# Altium schematic sheet Power Distribution.SchDoc
size B; SheetNumber: 3; SheetTotal: 6
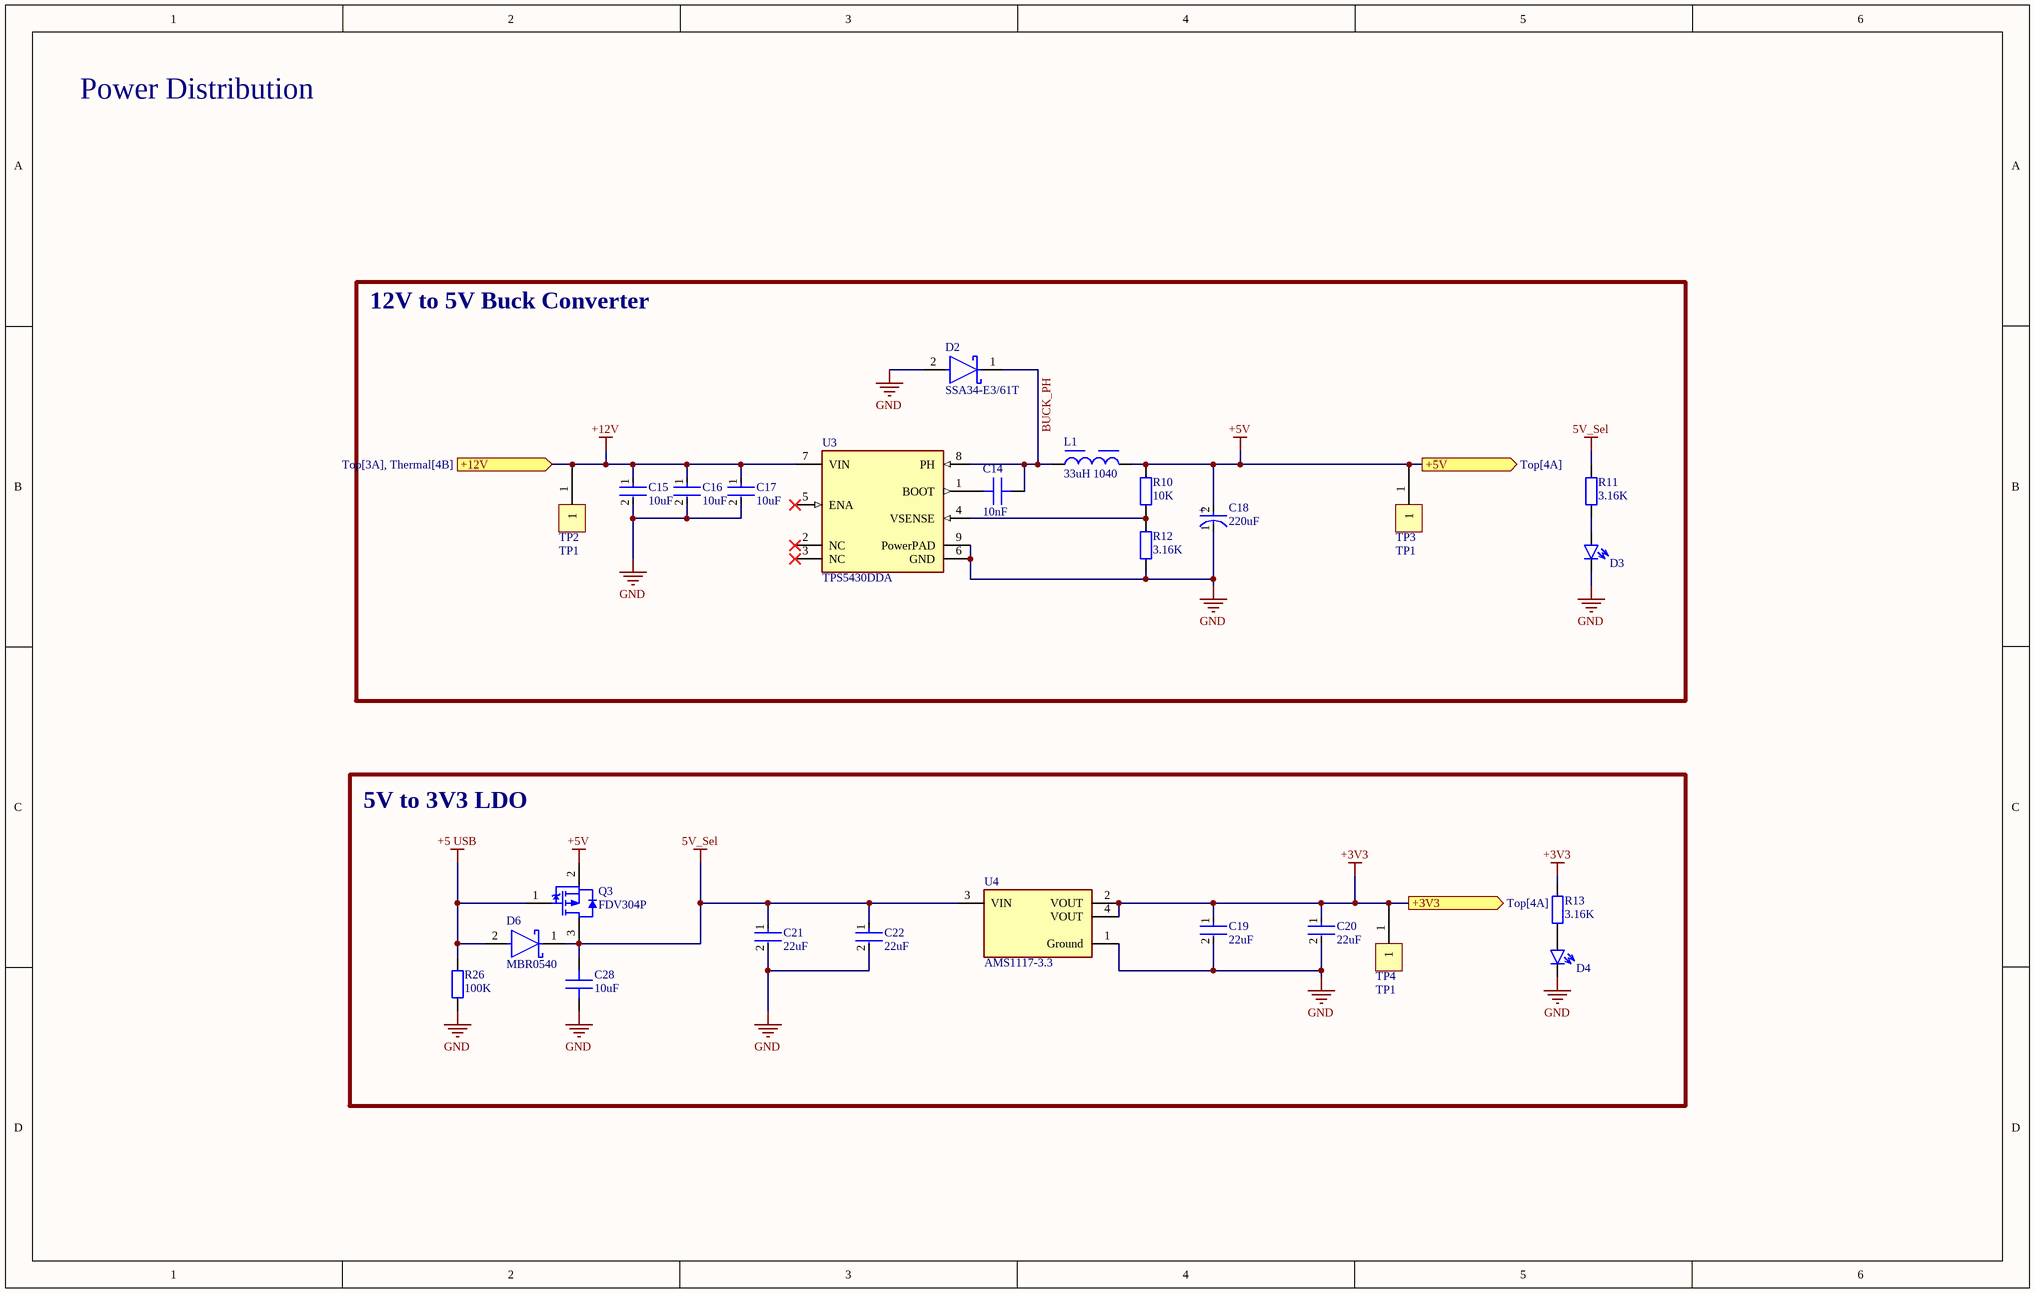
[diagram p0: Power Distribution.SchDoc]

## Parts
C14  10nF  [IPC C C0402 NO SILK]
C15  10uF  [FP-GRM21B-0_1-IPC_C]
C16  10uF  [FP-GRM21B-0_1-IPC_C]
C17  10uF  [FP-GRM21B-0_1-IPC_C]
C18  220uF  [FP-UCW1H221MNL1GS-MFG]
C19  22uF  [FP-GRM21B-0_15-MFG]
C20  22uF  [FP-GRM21B-0_15-MFG]
C21  22uF  [FP-GRM21B-0_15-MFG]
C22  22uF  [FP-GRM21B-0_15-MFG]
C28  10uF  [IPC C C0603 NO SILK]
D2  SSA34-E3/61T  [FP-95400-MFG]
D3  Generic LED 0603  [IPC C D0603]  (value not drawn)
D4  Generic LED 0603  [IPC C D0603]  (value not drawn)
D6  MBR0540  [FP-425-04-MFG]
L1  33uH 1040  [WE-LHMI_1040]
Q3  FDV304P  [FAIR-SOT23-3_V]
R10  10K  [IPC C R0402 NO SILK]
R11  3.16K  [IPC C R0402 NO SILK]
R12  3.16K  [IPC C R0402 NO SILK]
R13  3.16K  [IPC C R0402 NO SILK]
R26  100K  [IPC C R0603 NO SILK]
TP2  TP1  [TP1]
TP3  TP1  [TP1]
TP4  TP1  [TP1]
U3  TPS5430DDA  [FP-DDA0008J-MFG]
U4  AMS1117-3.3  [FP-AMS1117-IPC_C]

## Blocks framed on the sheet
12V to 5V Buck Converter: C14-C18 D2 D3 L1 R10-R12 TP2 TP3 U3
5V to 3V3 LDO: C19-C22 C28 D4 D6 Q3 R13 R26 TP4 U4

## Ports
+3V3 (out, see Top[4A]), +5V (out, see Top[4A]), +12V (in, see Top[3A], Thermal[4B])

## Nets
5V_Sel: C21.1 C22.1 C28.2 D6.1(C) Q3.3(D) R11.2 U4.3(VIN)
+3V3: C19.1 C20.1 R13.2 TP4.1 U4.2(VOUT) U4.4(VOUT) ; port +3V3
+5 USB: D6.2(A) Q3.1(G) R26.2
+5V: C18.2(A) L1.2 Q3.2(S) R10.2 TP3.1 ; port +5V
+12V: C15.1 C16.1 C17.1 TP2.1 U3.7(VIN) ; port +12V
GND: C15.2 C16.2 C17.2 C18.1(C) C19.2 C20.2 C21.2 C22.2 C28.1 D2.2(A) D3.2(C) D4.2(C) R12.1 R26.1 U3.6(GND) U3.9(PowerPAD) U4.1(Ground)
BUCK_PH: C14.2 D2.1(C) L1.1 U3.8(PH)
NetC14_1: C14.1 U3.1(BOOT)
NetD3_1: D3.1(A) R11.1
NetD4_1: D4.1(A) R13.1
NetR10_1: R10.1 R12.2 U3.4(VSENSE)

Not connected (* = marked no-connect by the designer): U3 2(NC)* 3(NC)* 5(ENA)*

## Notes on the sheet
- Power Distribution
- (in symbol CMP-12462-000041-1) +

## Library data of the parts
C14 = CMP-002-000000-1: Value: 10nF; Source: Schlib1.SchLib; Design Item ID: Generic CAP 0402
C15-C17 = CMP-2007-03453-2: GRM21BR61C106KE15L; Chip Multilayer Ceramic Capacitors for General Purpose, 0805, 10uF, X5R, 15%, 10%, 16V; Radiation Hardening: No; Thickness: 0.053inch; Voltage Rating (DC): 16V; Lead Free: Lead Free; Package Quantity: 1; Width: 1.25mm; Case Code (Imperial): 0805; Depth: 1.25mm; Packaging: Tape and Reel; Dielectric: X5R; Max Operating Temperature: 85°C; Tolerance: 10%; Voltage Rating: 16V; Voltage: 16V; Capacitance: 10uF; Height: 1.25mm; Case Code (Metric): 2012; Material: Ceramic; Mount: Surface Mount; Case/Package: 0805; REACH SVHC: No SVHC; Length: 2mm; Min Operating Temperature: -55°C; Termination: SMD/SMT
C18 = CMP-12462-000041-1: UCW1H221MNL1GS; CAP ALUM 220UF 20% 50V SMD; Dissipation Factor: 0.14%; Ripple Current: 670mA; Dielectric Material: Aluminium; Life (Hours): 7000Hour; Impedance: 350mR; Leakage Current: 3uA; Capacitance: 220uF; Max Operating Temperature: 105°C; Features: General Purpose; Voltage Rating: 50V; Case/Package: Radial; Termination: SMD/SMT; Tolerance: 20%; Package Quantity: 500; Construction: Cylindrical; REACH SVHC: No SVHC; Width: 10.3mm; Min Operating Temperature: -25°C; RoHS Compliant: Yes; Mount: Surface Mount; Diameter: 10mm; Voltage: 50V; Series: CW; Voltage Rating (DC): 50V; Ripple Current (AC): 670mA; Radiation Hardening: No; Length: 10mm; Packaging: Tape and Reel; Height: 10mm; Height - Seated (Max): 0.394inch
C19-C22 = CMP-2007-03385-2: GRM21BR60J226ME39L; Chip Multilayer Ceramic Capacitors for General Purpose, 0805, 22uF, X5R, 15%, 20%, 6.3V; Material: Ceramic; Max Operating Temperature: 85°C; Voltage: 6.3V; Min Operating Temperature: -55°C; Case/Package: 0805; Thickness: 0.053inch; Dielectric: X5R; Packaging: Tape and Reel; Depth: 1.25mm; Termination: SMD/SMT; Voltage Rating (DC): 6.3V; Radiation Hardening: No; Tolerance: 20%; Mount: Surface Mount; Lead Free: Lead Free; Package Quantity: 1; REACH SVHC: No SVHC; Voltage Rating: 6.3V; Capacitance: 22uF; Length: 2mm; Case Code (Imperial): 0805; Case Code (Metric): 2012; Width: 0.049inch; Height: 1.25mm
C28 = CMP-002-000001-1: Value: 10uF; Source: Schlib1.SchLib; Design Item ID: Generic CAP 0603
D2 = CMP-02539-000022-2: DIODE SCHOTTKY 40V 3A DO214AC; Element Configuration: Single; Max Reverse Leakage Current: 200uA; Polarity: Standard; Peak Non-Repetitive Surge Current: 75A; Forward Voltage: 490mV; Radiation Hardening: No; Current Rating: 3A; Contact Plating: Tin; Output Current: 3A; Height: 2.087mm; Mount: Surface Mount; Case/Package: SMA; Packaging: Tape and Reel; Width: 2.79mm; Average Rectified Current: 3A; Max Repetitive Reverse Voltage (Vrrm): 40V; Max Operating Temperature: 150°C; Length: 4.5mm; RoHS Compliant: Yes; Max Reverse Current: 200uA; Voltage Rating (DC): 40V; Min Operating Temperature: -65°C; Max Reverse Voltage (DC): 40V; Number of Pins: 2; Max Forward Surge Current (Ifsm): 75A; Lead Free: Lead Free; Forward Current: 3A; Max Surge Current: 75A; Package Quantity: 1
D3 D4 = CMP-006-000001-1: Design Item ID: Generic LED 0603; Source: Schlib1.SchLib
D6 = CMP-2000-05114-2: DIODE SCHOTTKY 40V 500MA SOD123; Max Surge Current: 5.5A; Max Reverse Leakage Current: 20uA; Forward Voltage: 620mV; Element Configuration: Single; Polarity: Standard; Power Dissipation: 400mW; Current Rating: 500A; Max Operating Temperature: 125°C; REACH SVHC: No SVHC; Voltage Rating (DC): 40V; Mount: Surface Mount; Max Reverse Voltage (DC): 40V; Max Forward Surge Current (Ifsm): 5.5A; Height: 1.03mm; Package Quantity: 3000; Forward Current: 500mA; Average Rectified Current: 500mA; Weight: 0.03g; Output Current: 500mA; Contact Plating: Tin; Packaging: Tape and Reel; Width: 1.6mm; Radiation Hardening: No; Peak Non-Repetitive Surge Current: 5.5A; Max Repetitive Reverse Voltage (Vrrm): 40V; Length: 2.7mm; Lead Free: Lead Free; Min Operating Temperature: -65°C; Number of Pins: 2; Peak Reverse Current: 20uA
L1 = CMP-1353-00014-4: NexarPartId: 67091305; Saturation Current: 3.3A; DC Resistance (DCR): 92mΩ; Inductance Tolerance: 20%; Inductance: 33µH; Max Operating Temperature: 125°C; Ambient Temperature Range High: 85°C; Min Operating Temperature: -40°C; Length: 11mm; Ambient Temperature Range Low: -40°C; Height: 3.8mm; Width: 10mm; RoHS: Compliant
Q3 = CMP-2000-06263-1: P-Channel Digital FET, -25 V, -0.46 A, 0.35 W, -55 to 150 degC, 3-Pin SOT-23, -55 to 150 degC, RoHS, Tape and Reel; Manufacturer: FairchildSemiconductor; Rad Hard: No; Typical Fall Time: 35ns; Typical Rise Time: 8ns; Channel Mode: Enhancement; Maximum Continuous Drain Current: 0.46A; RDS-on: 1100@4.5VmOhm; Maximum Drain Source Voltage: 25V; Package Version: Rev. 12, 03/2016; Typical Turn-On Delay Time: 6ns; Maximum Gate Source Voltage: 8V; Channel Type: P; Typical Turn-Off Delay Time: 55ns; Datasheet Version: Rev. E1, 08/1997; Package Description: 3-Pin Small Outline Transistor, Body 2.92 x 1.325 mm, Pitch 0.95 mm; Operating Temperature: -55to150°C; Package Reference: SOT23-3; Manufacturer URL: https://www.fairchildsemi.com/; Package URL: http://www.fairchildsemi.com/dwg/MA/MA03D.pdf; Package: 3SOT-23; Category: MOSFET; Packaging: Tape&Reel; Mounting: SurfaceMount; Datasheet URL: https://www.fairchildsemi.com/datasheets/FD/FDV304P.pdf; Mounting Technology: SurfaceMount
R10-R13 = CMP-008-000000-1: Generic RES 0402; Source: Schlib1.SchLib; Design Item ID: Generic RES 0402
  R10: Value: 10K
  R11-R13: Value: 3.16K
R26 = CMP-008-000001-1: Value: 100K; Source: Schlib1.SchLib; Design Item ID: Generic RES 0603
TP2-TP4 = CMP-00003-3: Testpoint double sided
U3 = CMP-2000-04960-2: IC REG BUCK ADJUSTABLE 3A 8SOPWR; Manufacturer: Texas Instruments; Max Junction Temp: +125°C; Max Supply Voltage: 36V; Switching Frequency: 500kHz; Output Type: AdjustableProgrammable; Standoff Height: 0mm; Output Voltage: 1.23-31V; Max Duty Cycle: 89%; Nominal Supply Current: 3mA; Min Supply Voltage: 5.5V; Number Of Outputs: 1; Temperature: -40°C to +125°C; Temperature Range High: +125°C; Manufacturer Part Number: TPS5430DDA; Device Class L3: Voltage Regulators - Switching; Mouser Description: Voltage Regulators - Switching Regulators 5.5 to 36V Input 3A Step Dwn Converter; Switching Topology: Buck; ComponentLink2URL: http://www.ti.com/lit/ds/symlink/tps5431.pdf; ComponentLink2Description: Datasheet; Device Class L2: Power Management ICs; Device Class L1: Integrated Circuits (ICs); Digikey Description: IC REG BUCK ADJUSTABLE 3A 8SOPWR; RoHS: TRUE; Octopart: https://octopart.com/tps5430dda-texas+instruments-589977; Output Current: 3A; Automotive: No; Lead Free: Yes; Category: IC; Package: DDA0008J; Temperature Range Low: -40°C; Height: 1.7mm
U4 = CMP-209535-000001-1: LDO Voltage Regulators 1A, 3.3V; Manufacturer: Advanced Monolithic Systems; Dropout Voltage: 1.1V; Output Type: Fixed; Nominal Supply Current: 5mA; Max Power Dissipation: 1.2W; Max Supply Voltage: 15V; Number Of Outputs: 1; Standoff Height: 0.64mm; Max Junction Temp: +125°C; Height: 1.8mm; Package: AMS1117; Device Class L2: Power Management ICs; ComponentLink2Description: Datasheet; ComponentLink2URL: http://www.advanced-monolithic.com/pdf/ds1117.pdf; Category: IC; RoHS: TRUE; Automotive: No; Device Class L1: Integrated Circuits (ICs); Output Current: 1A; Device Class L3: Voltage Regulators - Linear; Temperature: -40°C to +125°C; Output Voltage: 3.3V; Manufacturer Part Number: AMS1117-3.3; Temperature Range Low: -40°C; Octopart: https://octopart.com/ams1117-3.3-advanced+monolithic+systems-25899300; Lead Free: Yes; Ipc Land Pattern Name: SOT229P700X180-4; Temperature Range High: +125°C